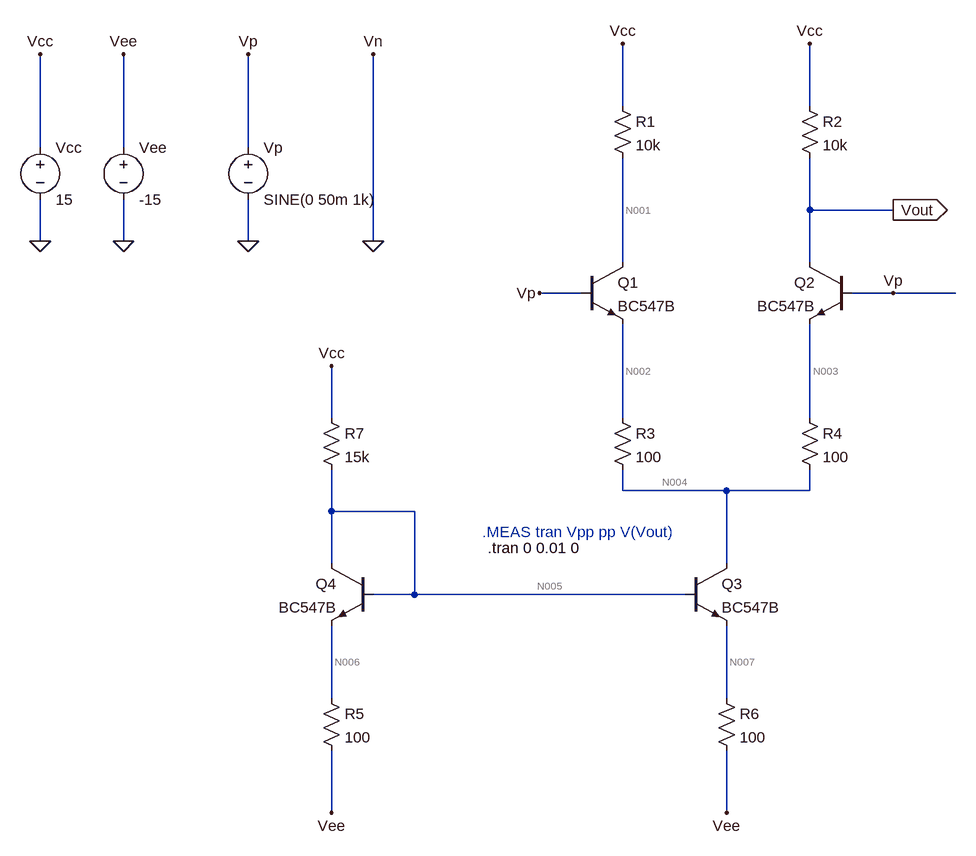
[diagram p0: schematic Draft3.asc]
Draft3.asc, the LTspice schematic file:
Version 4
SHEET 1 1128 1244
WIRE 96 48 96 -48
WIRE 384 48 384 -48
WIRE -800 112 -800 -32
WIRE -672 112 -672 -32
WIRE -480 112 -480 -32
WIRE 384 208 384 128
WIRE 512 208 384 208
WIRE -800 256 -800 192
WIRE -672 256 -672 192
WIRE -480 256 -480 192
WIRE -288 256 -288 -32
WIRE 96 288 96 128
WIRE 384 288 384 208
WIRE 32 336 -32 336
WIRE 512 336 448 336
WIRE 608 336 512 336
WIRE -352 528 -352 448
WIRE 96 528 96 384
WIRE 384 528 384 384
WIRE 96 640 96 608
WIRE 256 640 96 640
WIRE 384 640 384 608
WIRE 384 640 256 640
WIRE -352 672 -352 608
WIRE -224 672 -352 672
WIRE -352 752 -352 672
WIRE 256 752 256 640
WIRE -224 800 -224 672
WIRE -224 800 -288 800
WIRE 192 800 -224 800
WIRE -352 960 -352 848
WIRE 256 960 256 848
WIRE -352 1136 -352 1040
WIRE 256 1136 256 1040
FLAG -352 448 Vcc
FLAG 96 -48 Vcc
FLAG 384 -48 Vcc
FLAG -352 1136 Vee
FLAG 256 1136 Vee
FLAG -32 336 Vp
FLAG 512 336 Vp
FLAG -800 256 0
FLAG -672 256 0
FLAG -800 -32 Vcc
FLAG -672 -32 Vee
FLAG -480 256 0
FLAG -480 -32 Vp
FLAG -288 256 0
FLAG -288 -32 Vn
FLAG 512 208 Vout
IOPIN 512 208 Out
SYMBOL res 80 32 R0
SYMATTR InstName R1
SYMATTR Value 10k
SYMBOL res 368 32 R0
SYMATTR InstName R2
SYMATTR Value 10k
SYMBOL res 80 512 R0
SYMATTR InstName R3
SYMATTR Value 100
SYMBOL res 368 512 R0
SYMATTR InstName R4
SYMATTR Value 100
SYMBOL res -368 944 R0
SYMATTR InstName R5
SYMATTR Value 100
SYMBOL res 240 944 R0
SYMATTR InstName R6
SYMATTR Value 100
SYMBOL res -368 512 R0
SYMATTR InstName R7
SYMATTR Value 15k
SYMBOL npn 32 288 R0
SYMATTR InstName Q1
SYMATTR Value BC547B
SYMBOL npn 448 288 M0
SYMATTR InstName Q2
SYMATTR Value BC547B
SYMBOL npn 192 752 R0
SYMATTR InstName Q3
SYMATTR Value BC547B
SYMBOL npn -288 752 M0
SYMATTR InstName Q4
SYMATTR Value BC547B
SYMBOL voltage -800 96 R0
WINDOW 123 0 0 Left 0
WINDOW 39 0 0 Left 0
SYMATTR InstName Vcc
SYMATTR Value 15
SYMBOL voltage -672 96 R0
WINDOW 123 0 0 Left 0
WINDOW 39 0 0 Left 0
SYMATTR InstName Vee
SYMATTR Value -15
SYMBOL voltage -480 96 R0
WINDOW 123 0 0 Left 0
WINDOW 39 0 0 Left 0
SYMATTR InstName Vp
SYMATTR Value SINE(0 50m 1k)
TEXT -112 728 Left 2 !.tran 0 0.01 0
TEXT -120 704 Left 2 ;.MEAS tran Vpp pp V(Vout)

The netlist it stands for:
* Draft3.asc
R1 Vcc N001 10k
R2 Vcc Vout 10k
R3 N002 N004 100
R4 N003 N004 100
R5 N006 Vee 100
R6 N007 Vee 100
R7 Vcc N005 15k
Q1 N001 Vp N002 0 BC547B
Q2 Vout Vp N003 0 BC547B
Q3 N004 N005 N007 0 BC547B
Q4 N005 N005 N006 0 BC547B
Vcc Vcc 0 15
Vee Vee 0 -15
Vp Vp 0 SINE(0 50m 1k)
.model NPN NPN
.model PNP PNP
.lib standard.bjt
.tran 0 0.01 0
* .MEAS tran Vpp pp V(Vout)
.backanno
.end

* Results of the author's LTspice run, read from the files saved beside the schematic
* Operating Point, zero values left out:
*   V(vcc) = 15 V
*   V(n001) = 5.146 V
*   V(vout) = 5.146 V
*   V(n002) = -636.5 mV
*   V(n004) = -735.3 mV
*   V(n003) = -636.5 mV
*   V(n006) = -14.81 V
*   V(vee) = -15 V
*   V(n007) = -14.8 V
*   V(n005) = -14.15 V
*   Ic(Q1) = 985.4 µA
*   Ib(Q1) = 3.22 µA
*   Ie(Q1) = -988.7 µA
*   Ic(Q2) = 985.4 µA
*   Ib(Q2) = 3.22 µA
*   Ie(Q2) = -988.7 µA
*   Ic(Q3) = 1.977 mA
*   Ib(Q3) = 5.774 µA
*   Ie(Q3) = -1.983 mA
*   Ic(Q4) = 1.931 mA
*   Ib(Q4) = 6.879 µA
*   Ie(Q4) = -1.938 mA
*   I(R1) = 985.4 µA
*   I(R2) = 985.4 µA
*   I(R3) = 988.7 µA
*   I(R4) = 988.7 µA
*   I(R5) = 1.938 mA
*   I(R6) = 1.983 mA
*   I(R7) = 1.943 mA
*   I(Vcc) = -3.914 mA
*   I(Vee) = 3.921 mA
*   I(Vp) = -6.44 µA
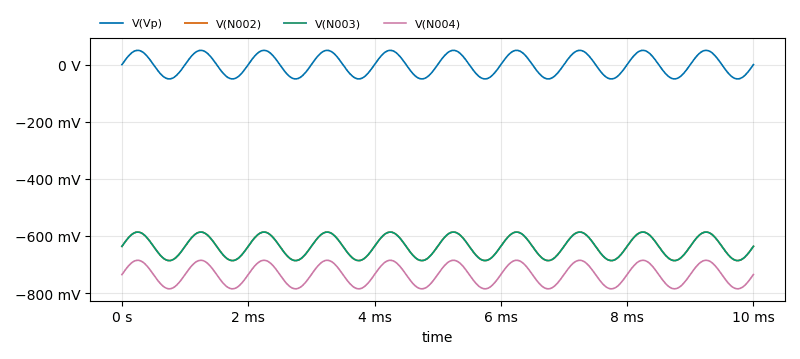
[diagram p1: Transient Analysis of Draft3.asc, plotted from the saved traces]
* Transient Analysis, 1 run:
*   V(Vp): min -49.99 mV, max 49.99 mV, average -81.82 nV, rms 35.38 mV, last 0 V
*   V(N002): min -686.4 mV, max -586.5 mV, average -636.5 mV, rms 637.4 mV, last -636.5 mV
*   V(N003): min -686.4 mV, max -586.5 mV, average -636.5 mV, rms 637.4 mV, last -636.5 mV
*   V(N004): min -785.2 mV, max -685.4 mV, average -735.3 mV, rms 736.2 mV, last -735.3 mV